# Altium schematic sheet 01.TC264_FMU.SchDoc: 01.TC264_FMU
size A4; Revision: V2.0; SheetNumber: 1; SheetTotal: 4; Project: TC264
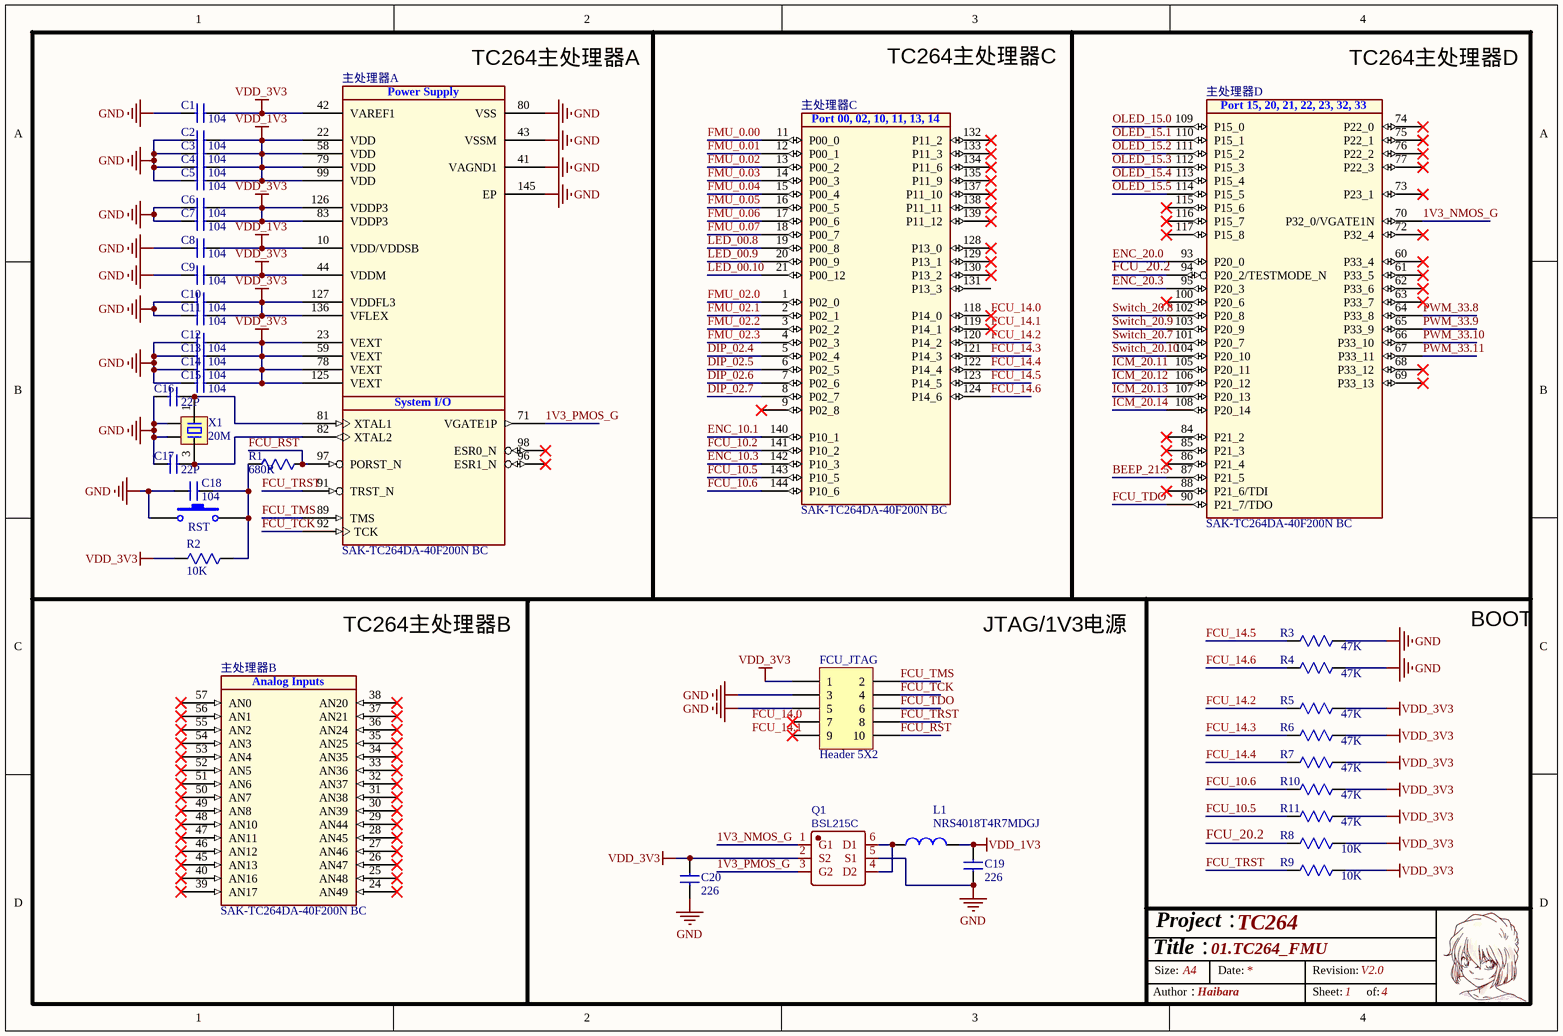
[diagram p0: 01.TC264_FMU.SchDoc]

## Parts
C1  104  [C0402]
C2  104  [C0402]
C3  104  [C0402]
C4  104  [C0402]
C5  104  [C0402]
C6  104  [C0402]
C7  104  [C0402]
C8  104  [C0402]
C9  104  [C0402]
C10  104  [C0402]
C11  104  [C0402]
C12  104  [C0402]
C13  104  [C0402]
C14  104  [C0402]
C15  104  [C0402]
C16  22P  [C0402]
C17  22P  [C0402]
C18  104  [C0402]
C19  226  [C0805]
C20  226  [C0805]
FCU_JTAG  Header 5X2  [HDR2.54-LI-2x5P]
L1  NRS4018T4R7MDGJ  [SWPA4030S]
Q1  BSL215C  [SOT23-6]
R1  680R  [R0402]
R2  10K  [R0402]
R3  47K  [R0402]
R4  47K  [R0402]
R5  47K  [R0402]
R6  47K  [R0402]
R7  47K  [R0402]
R8  10K  [R0402]
R9  10K  [R0402]
R10  47K  [R0402]
R11  47K  [R0402]
RST  SW-PB  [TSW SMD-3*6*2.5]  (value not drawn)
X1  20M  [OSC 3225-4P]
主处理器  SAK-TC264DA-40F200N BC  [QFP144_EP]  (parts A,B,C,D of 4)

## Nets
GND: C1.1 C2.1 C3.1 C4.1 C5.1 C6.1 C7.1 C8.1 C9.1 C10.1 C11.1 C12.1 C13.1 C14.1 C15.1 C16.1 C17.1 C18.1 C19.1 C20.1 FCU_JTAG.3 FCU_JTAG.5 Q1.5(S1) R3.2 R4.2 RST.1 X1.2 X1.4 主处理器.41(VAGND1) 主处理器.43(VSSM) 主处理器.80(VSS) 主处理器.145(EP)
VDD_1V3: C2.2 C3.2 C4.2 C5.2 C8.2 C19.2 L1.2 主处理器.10(VDD/VDDSB) 主处理器.22(VDD) 主处理器.58(VDD) 主处理器.79(VDD) 主处理器.99(VDD)
VDD_3V3: C1.2 C6.2 C7.2 C9.2 C10.2 C11.2 C12.2 C13.2 C14.2 C15.2 C20.2 FCU_JTAG.1 Q1.2(S2) R2.1 R5.2 R6.2 R7.2 R8.2 R9.2 R10.2 R11.2 主处理器.23(VEXT) 主处理器.42(VAREF1) 主处理器.44(VDDM) 主处理器.59(VEXT) 主处理器.78(VEXT) 主处理器.83(VDDP3) 主处理器.125(VEXT) 主处理器.126(VDDP3) 主处理器.127(VDDFL3) 主处理器.136(VFLEX)
1V3_NMOS_G: Q1.1(G1) 主处理器.70(P32_0/VGATE1N)
1V3_PMOS_G: Q1.3(G2) 主处理器.71(VGATE1P)
BEEP_21.5: 主处理器.87(P21_5)
DIP_02.4: 主处理器.5(P02_4)
DIP_02.5: 主处理器.6(P02_5)
DIP_02.6: 主处理器.7(P02_6)
DIP_02.7: 主处理器.8(P02_7)
ENC_10.1: 主处理器.140(P10_1)
ENC_10.3: 主处理器.142(P10_3)
ENC_20.0: 主处理器.93(P20_0)
ENC_20.3: 主处理器.95(P20_3)
FCU_10.2: 主处理器.141(P10_2)
FCU_10.5: R11.1 主处理器.143(P10_5)
FCU_10.6: R10.1 主处理器.144(P10_6)
FCU_14.0: 主处理器.118(P14_0)
FCU_14.1: 主处理器.119(P14_1)
FCU_14.2: R5.1 主处理器.120(P14_2)
FCU_14.3: R6.1 主处理器.121(P14_3)
FCU_14.4: R7.1 主处理器.122(P14_4)
FCU_14.5: R3.1 主处理器.123(P14_5)
FCU_14.6: R4.1 主处理器.124(P14_6)
FCU_20.2: R8.1 主处理器.94(P20_2/TESTMODE_N)
FCU_RST: FCU_JTAG.10 R1.2 主处理器.97(PORST_N)
FCU_TCK: FCU_JTAG.4 主处理器.92(TCK)
FCU_TDO: FCU_JTAG.6 主处理器.90(P21_7/TDO)
FCU_TMS: FCU_JTAG.2 主处理器.89(TMS)
FCU_TRST: FCU_JTAG.8 R9.1 主处理器.91(TRST_N)
FMU_0.00: 主处理器.11(P00_0)
FMU_0.01: 主处理器.12(P00_1)
FMU_0.02: 主处理器.13(P00_2)
FMU_0.03: 主处理器.14(P00_3)
FMU_0.04: 主处理器.15(P00_4)
FMU_0.05: 主处理器.16(P00_5)
FMU_0.06: 主处理器.17(P00_6)
FMU_0.07: 主处理器.18(P00_7)
FMU_02.0: 主处理器.1(P02_0)
FMU_02.1: 主处理器.2(P02_1)
FMU_02.2: 主处理器.3(P02_2)
FMU_02.3: 主处理器.4(P02_3)
ICM_20.11: 主处理器.105(P20_11)
ICM_20.12: 主处理器.106(P20_12)
ICM_20.13: 主处理器.107(P20_13)
ICM_20.14: 主处理器.108(P20_14)
LED_00.8: 主处理器.19(P00_8)
LED_00.9: 主处理器.20(P00_9)
LED_00.10: 主处理器.21(P00_12)
OLED_15.0: 主处理器.109(P15_0)
OLED_15.1: 主处理器.110(P15_1)
OLED_15.2: 主处理器.111(P15_2)
OLED_15.3: 主处理器.112(P15_3)
OLED_15.4: 主处理器.113(P15_4)
OLED_15.5: 主处理器.114(P15_5)
PWM_33.8: 主处理器.64(P33_8)
PWM_33.9: 主处理器.65(P33_9)
PWM_33.10: 主处理器.66(P33_10)
PWM_33.11: 主处理器.67(P33_11)
Switch_20.7: 主处理器.101(P20_7)
Switch_20.8: 主处理器.102(P20_8)
Switch_20.9: 主处理器.103(P20_9)
Switch_20.10: 主处理器.104(P20_10)
NetC16_2: C16.2 X1.1 主处理器.81(XTAL1)
NetC17_2: C17.2 X1.3 主处理器.82(XTAL2)
NetC18_2: C18.2 R1.1 R2.2 RST.2
NetL1_1: L1.1 Q1.4(D2) Q1.6(D1)

Not connected (* = marked no-connect by the designer): FCU_JTAG 7* 9*; 主处理器 9(P02_8)* 24(AN49)* 25(AN48)* 26(AN47)* 27(AN46)* 28(AN45)* 29(AN44)* 30(AN39)* 31(AN38)* 32(AN37)* 33(AN36)* 34(AN35)* 35(AN25)* 36(AN24)* 37(AN21)* 38(AN20)* 39(AN17)* 40(AN16)* 45(AN13)* 46(AN12)* 47(AN11)* 48(AN10)* 49(AN8)* 50(AN7)* 51(AN6)* 52(AN5)* 53(AN4)* 54(AN3)* 55(AN2)* 56(AN1)* 57(AN0)* 60(P33_4)* 61(P33_5)* 62(P33_6)* 63(P33_7)* 68(P33_12)* 69(P33_13)* 72(P32_4)* 73(P23_1)* 74(P22_0)* 75(P22_1)* 76(P22_2)* 77(P22_3)* 84(P21_2)* 85(P21_3)* 86(P21_4)* 88(P21_6/TDI)* 96(ESR1_N)* 98(ESR0_N)* 100(P20_6)* 115(P15_6)* 116(P15_7)* 117(P15_8)* 128(P13_0)* 129(P13_1)* 130(P13_2)* 131(P13_3) 132(P11_2)* 133(P11_3)* 134(P11_6)* 135(P11_9)* 137(P11_10)* 138(P11_11)* 139(P11_12)*

## Notes on the sheet
- (near 主处理器) TC264主处理器A
- TC264主处理器C
- TC264主处理器D
- TC264主处理器B
- JTAG/1V3电源
- BOOT
- Labels drawn without touching a wire or pin: FCU_14.0, FCU_14.1
- Title：
- Size:
- Project：
- A4
- Date:
- Revision:
- Author：
- Haibara
- Sheet:
- of:
- (in symbol SAK-TC264DA-40F200N BC, part A) Power Supply; System I/O
- (in symbol SAK-TC264DA-40F200N BC, part B) Analog Inputs
- (in symbol SAK-TC264DA-40F200N BC, part C) Port 00, 02, 10, 11, 13, 14
- (in symbol SAK-TC264DA-40F200N BC, part D) Port 15, 20, 21, 22, 23, 32, 33

## Library data of the parts
C1-C20 = 电容
FCU_JTAG = Header 5X2: Header, 5-Pin, Dual row; LatestRevisionDate: 17-Jul-2002; LatestRevisionNote: Re-released for DXP Platform.; Publisher: Altium Limited
L1 = 电感
Q1 = BSL215CH6327XTSA1: BOM_Manufacturer: Infineon; Contributor: LCSC; BOM_Supplier: LCSC; BOM_Manufacturer Part: BSL215CH6327XTSA1; BOM_Supplier Part: C150914; BOM_JLCPCB Part Class: Extended Part; spicePre: Q; spiceSymbolName: BSL215CH6327XTSA1
R1-R11 = 电阻
RST = SW-PB: Switch; Published: 24-Mar-1999; LatestRevisionDate: 17-Jul-2002; LatestRevisionNote: Re-released for DXP Platform.; PackageReference: SPST-2; Publisher: Altium Limited; PackageDescription: Switch; 2 Leads
X1 = XTAL-4P: 4脚无源晶振; 版权归属: 源创客; BOM名称: 4脚无源晶振; 学习资源: www.ooocke.com
主处理器 = SAK-TC264DA-40F200N BC: 32-Bit Single-Chip Microcontroller BC-Step; Manufacturer: Infineon Technologies; PackageReference: PG-LQFP-144-22; ManufacturerPartNumber: SAK-TC264DA-40F200N BC